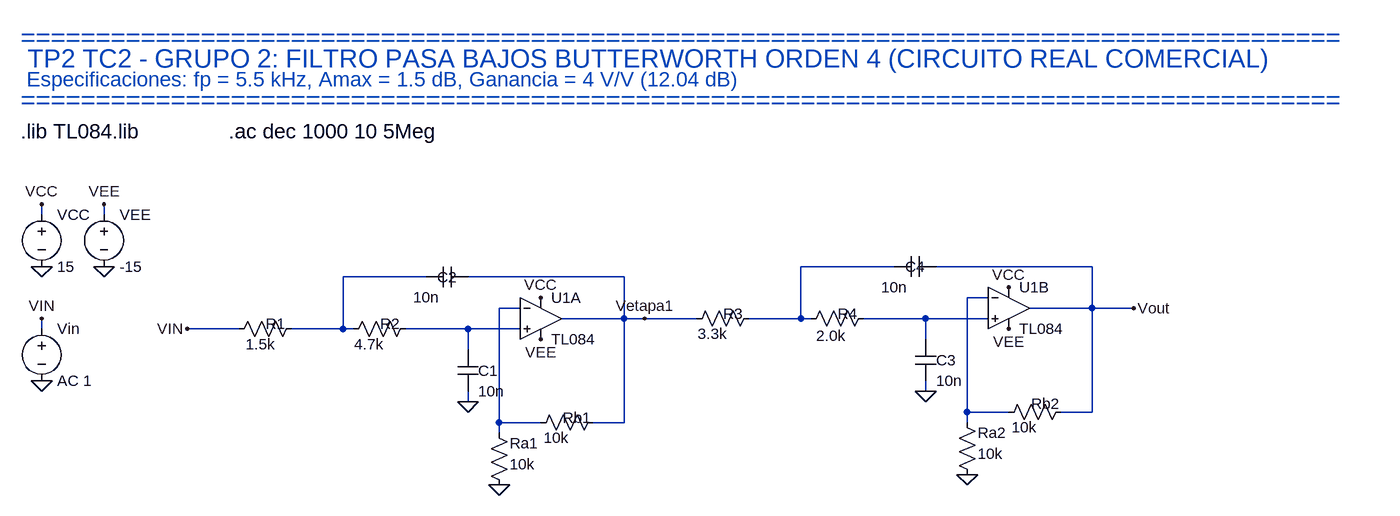
[diagram p0: schematic Filtro_PasaBajos_Solo_TL084.asc]
Filtro_PasaBajos_Solo_TL084.asc, the LTspice schematic file:
Version 4.1
SHEET 1 2776 900
WIRE 96 304 96 288
WIRE 192 304 192 288
WIRE 1408 384 1264 384
WIRE 1712 384 1472 384
WIRE 688 400 560 400
WIRE 992 400 752 400
WIRE 1552 432 1520 432
WIRE 832 448 800 448
WIRE 1712 448 1712 384
WIRE 1712 448 1616 448
WIRE 1776 448 1712 448
WIRE 992 464 992 400
WIRE 992 464 896 464
WIRE 1024 464 992 464
WIRE 1104 464 1024 464
WIRE 1264 464 1264 384
WIRE 1264 464 1184 464
WIRE 1280 464 1264 464
WIRE 1456 464 1360 464
WIRE 1552 464 1456 464
WIRE 96 480 96 464
WIRE 400 480 320 480
WIRE 560 480 560 400
WIRE 560 480 480 480
WIRE 576 480 560 480
WIRE 752 480 656 480
WIRE 832 480 752 480
WIRE 1456 496 1456 464
WIRE 752 512 752 480
WIRE 1456 576 1456 560
WIRE 752 592 752 576
WIRE 1520 608 1520 432
WIRE 1584 608 1520 608
WIRE 1712 608 1712 448
WIRE 1712 608 1664 608
WIRE 800 624 800 448
WIRE 864 624 800 624
WIRE 992 624 992 464
WIRE 992 624 944 624
WIRE 1520 624 1520 608
WIRE 800 640 800 624
FLAG 96 288 VCC
FLAG 96 384 0
FLAG 192 288 VEE
FLAG 192 384 0
FLAG 96 464 VIN
FLAG 96 560 0
FLAG 320 480 VIN
FLAG 752 592 0
FLAG 864 432 VCC
FLAG 864 496 VEE
FLAG 1024 464 Vetapa1
FLAG 800 720 0
FLAG 1456 576 0
FLAG 1584 416 VCC
FLAG 1584 480 VEE
FLAG 1776 448 Vout
FLAG 1520 704 0
SYMBOL voltage 96 288 R0
WINDOW 123 0 0 Left 2
WINDOW 39 0 0 Left 2
SYMATTR InstName VCC
SYMATTR Value 15
SYMBOL voltage 192 288 R0
WINDOW 123 0 0 Left 2
WINDOW 39 0 0 Left 2
SYMATTR InstName VEE
SYMATTR Value -15
SYMBOL voltage 96 464 R0
WINDOW 123 0 0 Left 2
WINDOW 39 0 0 Left 2
SYMATTR InstName Vin
SYMATTR Value AC 1
SYMBOL res 496 464 R90
WINDOW 0 24 40 VBottom 2
WINDOW 3 24 63 VTop 2
SYMATTR InstName R1
SYMATTR Value 1.5k
SYMBOL res 672 464 R90
WINDOW 0 24 40 VBottom 2
WINDOW 3 24 72 VTop 2
SYMATTR InstName R2
SYMATTR Value 4.7k
SYMBOL cap 736 512 R0
WINDOW 0 32 32 Left 2
WINDOW 3 32 64 Left 2
SYMATTR InstName C1
SYMATTR Value 10n
SYMBOL cap 752 384 R90
WINDOW 0 32 32 VBottom 2
WINDOW 3 32 64 VTop 2
SYMATTR InstName C2
SYMATTR Value 10n
SYMBOL OpAmps\\opamp2 864 400 R0
SYMATTR InstName U1A
SYMATTR Value TL084
SYMBOL res 784 624 R0
WINDOW 0 32 32 Left 2
WINDOW 3 32 64 Left 2
SYMATTR InstName Ra1
SYMATTR Value 10k
SYMBOL res 960 608 R90
WINDOW 0 24 40 VBottom 2
WINDOW 3 24 72 VTop 2
SYMATTR InstName Rb1
SYMATTR Value 10k
SYMBOL res 1200 448 R90
WINDOW 0 24 40 VBottom 2
WINDOW 3 24 72 VTop 2
SYMATTR InstName R3
SYMATTR Value 3.3k
SYMBOL res 1376 448 R90
WINDOW 0 24 40 VBottom 2
WINDOW 3 27 65 VTop 2
SYMATTR InstName R4
SYMATTR Value 2.0k
SYMBOL cap 1440 496 R0
WINDOW 0 32 32 Left 2
WINDOW 3 32 64 Left 2
SYMATTR InstName C3
SYMATTR Value 10n
SYMBOL cap 1472 368 R90
WINDOW 0 32 32 VBottom 2
WINDOW 3 32 64 VTop 2
SYMATTR InstName C4
SYMATTR Value 10n
SYMBOL OpAmps\\opamp2 1584 384 R0
SYMATTR InstName U1B
SYMATTR Value TL084
SYMBOL res 1504 608 R0
WINDOW 0 32 32 Left 2
WINDOW 3 32 64 Left 2
SYMATTR InstName Ra2
SYMATTR Value 10k
SYMBOL res 1680 592 R90
WINDOW 0 19 39 VBottom 2
WINDOW 3 24 72 VTop 2
SYMATTR InstName Rb2
SYMATTR Value 10k
TEXT 64 32 Left 4 ;========================================================================================
TEXT 64 64 Left 4 ; TP2 TC2 - GRUPO 2: FILTRO PASA BAJOS BUTTERWORTH ORDEN 4 (CIRCUITO REAL COMERCIAL)
TEXT 64 96 Left 3 ; Especificaciones: fp = 5.5 kHz, Amax = 1.5 dB, Ganancia = 4 V/V (12.04 dB)
TEXT 64 128 Left 4 ;========================================================================================
TEXT 64 176 Left 3 !.lib TL084.lib
TEXT 384 176 Left 3 !.ac dec 1000 10 5Meg

The netlist it stands for:
* Filtro_PasaBajos_Solo_TL084.asc
VCC VCC 0 15
VEE VEE 0 -15
Vin VIN 0 AC 1
R1 N002 VIN 1.5k
R2 N006 N002 4.7k
C1 N006 0 10n
C2 Vetapa1 N002 10n
X§U1A N006 N004 VCC VEE Vetapa1 TL084  ; pins In+ In- V+ V- OUT
Ra1 N004 0 10k
Rb1 Vetapa1 N004 10k
R3 N001 Vetapa1 3.3k
R4 N005 N001 2.0k
C3 N005 0 10n
C4 Vout N001 10n
X§U1B N005 N003 VCC VEE Vout TL084  ; pins In+ In- V+ V- OUT
Ra2 N003 0 10k
Rb2 Vout N003 10k
* ========================================================================================
*  TP2 TC2 - GRUPO 2: FILTRO PASA BAJOS BUTTERWORTH ORDEN 4 (CIRCUITO REAL COMERCIAL)
*  Especificaciones: fp = 5.5 kHz, Amax = 1.5 dB, Ganancia = 4 V/V (12.04 dB)
* ========================================================================================
.lib TL084.lib
.ac dec 1000 10 5Meg
.backanno
.end